# Altium schematic sheet GPS_GNSS.SchDoc
size A4; SheetNumber: 5; SheetTotal: 5
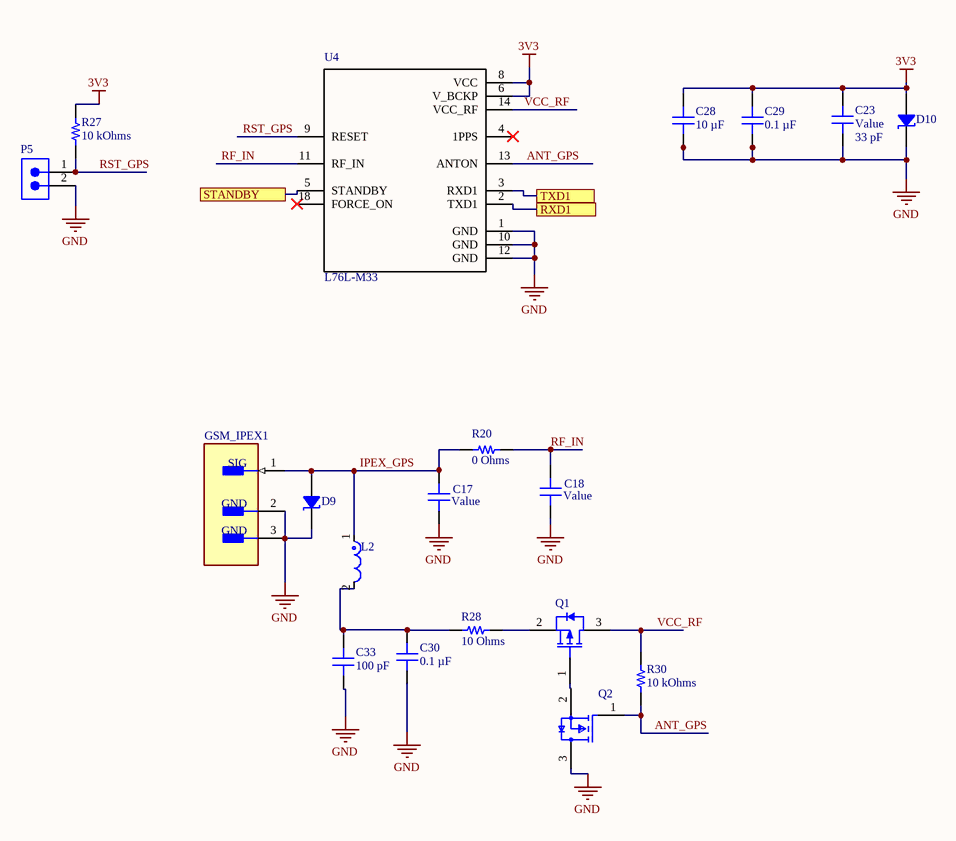
[diagram p0: GPS_GNSS.SchDoc]

## Parts
C17  Value  [CAP 0402_1005]
C18  Value  [CAP 0402_1005]
C23  Value  Capacitance: 33 pF  [CAP 0402_1005]
C28  10 µF  [CAP 0805_2012]
C29  0.1 µF  [CAP 0402_1005]
C30  0.1 µF  [CAP 0402_1005]
C33  100 pF  [CAP 0402_1005]
D9  PESD5V0S1USF,315  [NEXPERIA SOD962-2 DSN0603-2]  (value not drawn)
D10  ESD5Z3.3T5G  [SOD523F]  (value not drawn)
GSM_IPEX1  U.FL-R-SMT-1(10)  [FP-U_FL-R-SMT-1_10-MFG]  (value not drawn)
L2  LQG15HS47NJ02J  [FP-LQG15HH_02-IPC_B]  (value not drawn)
P5  MTLW-102-05-G-S-172  [SMTC-MTLW-102-05-X-S-172]  (value not drawn)
Q1  AO3401A  [AO-SOT-23-3L_V]  (value not drawn)
Q2  AO3400A  [FP-SOT23-MFG]  (value not drawn)
R20  0 Ohms  [RES 0402_1005]
R27  10 kOhms  [RES 0402_1005]
R28  10 Ohms  [RES 0402_1005]
R30  10 kOhms  [RES 0402_1005]
U4  L76L-M33  [*XCVR_L76L-M33]

## Ports
RXD1, STANDBY, TXD1

## Nets
3V3: C23.2 C28.2 C29.2 D10.1 R27.2 U4.6(V_BCKP) U4.8(VCC)
GND: C17.1 C18.1 C23.1 C28.1 C29.1 C30.1 C33.1 D9.1 D10.2 GSM_IPEX1.2(GND) GSM_IPEX1.3(GND) P5.2 Q2.3(D) U4.1(GND) U4.10(GND) U4.12(GND)
ANT_GPS: Q2.1(G) R30.1 U4.13(ANTON)
IPEX_GPS: C17.2 D9.2 GSM_IPEX1.1(SIG) L2.1 R20.1
RF_IN: C18.2 R20.2 U4.11(RF_IN)
RST_GPS: P5.1 R27.1 U4.9(RESET)
RXD1: U4.2(TXD1) ; port RXD1
STANDBY: U4.5(STANDBY) ; port STANDBY
TXD1: U4.3(RXD1) ; port TXD1
VCC_RF: Q1.3(DRAIN) R30.2 U4.14(VCC_RF)
NetC30_2: C30.2 C33.2 L2.2 R28.1
NetQ1_1: Q1.1(GATE) Q2.2(S)
NetQ1_2: Q1.2(SOURCE) R28.2

Not connected (* = marked no-connect by the designer): U4 4(1PPS)* 18(FORCE_ON)*

## Library data of the parts
C17 C18 = NMC0402X5R105K6.3TRPF: CAP SMT04021F6.3VDC; Capacitance: 1 µF; Part Number: NMC0402X5R105K6.3TRPF
C23 = GMC04CG330F50NT: CAP0402 COG 33PF 1% 50V; Part Number: GMC04CG330F50NT
C28 = GMC21X7S106K6R3NT: CAP0805 X7S 10UF 10% 6.3V; manufacturer: Cal-Chip Electronics, Inc.; Part Number: GMC21X7S106K6R3NT; Capacitance: 10 µF; Applications: General Purpose; componentlink1description: Datasheet; componentlink1url: https://calchip.com/wp-content/uploads/2024/02/gmc_series-1.pdf; componentlink2description: DigiKey Link; componentlink2url: https://www.digikey.com/en/products/detail/cal-chip-electronics-inc/GMC21X7S106K6R3NT/25820663; Device Package: 0805 (2012 Metric); lastupdated: 06/04/2026 7:28:46 PM; Lifecycle Status: Active; Minimum Order: 1; Mounting Type: Surface Mount, MLCC; Operating Temperature: -55°C ~ 125°C; Package / Case: 0805 (2012 Metric); packaging: TapeAndReel; partid: 69922; price: 0.08; series: GMC; Size / Dimension: 0.079" L x 0.049" W (2.00mm x 1.25mm); Supplier 1: DigiKey; Supplier Part Number 1: 4713-GMC21X7S106K6R3NTCT-ND; Temperature Coefficient: X7S; Thickness (Max): 0.057" (1.45mm); Tolerance: ±10%; value: 10 µF; Voltage - Rated: 6.3V
C29 C30 = 885012105001: CAP CER 0.1UF 6.3V X5R 0402; manufacturer: Würth Elektronik; Tolerance: ±20%; Part Number: 885012105001; Capacitance: 0.1 µF; Applications: General Purpose; componentlink1description: Datasheet; componentlink1url: https://katalog.we-online.de/pbs/datasheet/885012105001.pdf; componentlink2description: DigiKey Link; componentlink2url: https://www.digikey.com/en/products/detail/würth-elektronik/885012105001/5453333; Device Package: 0402 (1005 Metric); lastupdated: 06/04/2026 7:11:10 PM; Lifecycle Status: Active; Minimum Order: 1; Mounting Type: Surface Mount, MLCC; Operating Temperature: -55°C ~ 85°C; Package / Case: 0402 (1005 Metric); packaging: TapeAndReel; partid: 1931; Part Status: Active; price: 0.01; series: WCAP-CSGP; Size / Dimension: 0.039" L x 0.020" W (1.00mm x 0.50mm); Supplier 1: DigiKey; Supplier Part Number 1: 732-7478-1-ND; Temperature Coefficient: X5R; Thickness (Max): 0.022" (0.55mm); value: 0.1 µF; Voltage - Rated: 6.3V
C33 = GMC04CG101F16NT: CAP0402 COG 100PF 1% 16V; manufacturer: Cal-Chip Electronics, Inc.; Temperature Coefficient: C0G, NP0; Part Number: GMC04CG101F16NT; Capacitance: 100 pF; Applications: General Purpose; componentlink1description: Datasheet; componentlink1url: https://calchip.com/wp-content/uploads/2024/02/gmc_series-1.pdf; componentlink2description: DigiKey Link; componentlink2url: https://www.digikey.com/en/products/detail/cal-chip-electronics-inc/GMC04CG101F16NT/22577097; Device Package: 0402 (1005 Metric); lastupdated: 06/04/2026 7:07:17 PM; Lifecycle Status: Active; Minimum Order: 1; Mounting Type: Surface Mount, MLCC; Operating Temperature: -55°C ~ 125°C; Package / Case: 0402 (1005 Metric); packaging: TapeAndReel; partid: 63248; price: 0.01; series: GMC; Size / Dimension: 0.039" L x 0.020" W (1.00mm x 0.50mm); Supplier 1: DigiKey; Supplier Part Number 1: 4713-GMC04CG101F16NTCT-ND; Thickness (Max): 0.022" (0.55mm); Tolerance: ±1%; value: 100 pF; Voltage - Rated: 16V
D9 = PESD5V0S1USF,315: TVS DIODE 5VWM 11VC DSN0603-2; Part Number: PESD5V0S1USF,315
D10 = ESD5Z3.3T5G: TVS DIODE 3.3VWM 14.1VC SOD523; Part Number: ESD5Z3.3T5G
GSM_IPEX1 = CMP-2000-05152-3: CONN U.FL RCPT STR 50 OHM SMD; Max Frequency: 6GHz; Connector Type: Coaxial; Body Plating: Silver; Body Material: Bronze; Impedance: 50R; Dielectric Material: Polymer; Insulation Resistance: 500MR; Gender: Male; Packaging: Cut Tape; Length: 3mm; Package Quantity: 2500; Termination: Solder; Lead Free: Lead Free; Series: U.FL; Min Operating Temperature: -40°C; Fastening Type: Snap; Contact Material: Brass; Orientation: Straight; Wire/Cable Type: Coaxial; Frequency: 6GHz; Contact Plating: Gold; Depth: 3.1mm; Weight: 0.001764oz; Max Operating Temperature: 90°C; Radiation Hardening: No; REACH SVHC: No SVHC; Mount: Surface Mount; Housing Color: Beige
L2 = CMP-06042-003943-1: Multilayer type RF Inductor 47nH ±5% 0.72Ω 300mA 0402
P5 = CMP-1024-00064-1: Low Profile .025" SQ Post Header, Through-hole, Vertical, -55 to 125 degC, 2.54 mm Pitch, 2-Pin, Male, RoHS; Manufacturer: Samtec; Pitch: 2.54 mm; ComponentLink2URL: http://www.samtec.com/documents/webfiles/pdf/MTLW_TH.PDF; PackageDescription: Low Profile Terminal Assembly; ComponentLink3URL: http://www.samtec.com/documents/webfiles/cpdf/MTLW-1XX-XX-XX-X-XXX-XX-XX-MKT1.pdf; PackageReference: MTLW-102-05-X-S-172; Mounting Technology: Through-hole; ComponentLink2Description: Datasheet; PackageVersion: T, 6/1991; Orientation: Vertical; DatasheetVersion: F-214; RoHS: True; ComponentLink3Description: Package Specification; ComponentLink1URL: http://www.samtec.com; Temperature Range: -55 to 125 degC; PartNumber: MTLW-102-05-G-S-172; ComponentLink1Description: Manufacturer URL
Q1 = CMP-2000-05778-1: P-Channel MOSFET, 30 V, 4 A, -55 to 150 degC, 3-Pin SOT-23-3L, RoHS, Tape and Reel; Manufacturer: Alpha and Omega; Output Power (Max): NotRequiredW; Power Dissipation: 1.4W; Rad Hardened: No; Drain Efficiency: NotRequired%; Drain-Source On-Volt: 30V; Noise Figure: NotRequireddB; Frequency (Max): NotRequiredMHz; Number of  Elements: 1; Gate-Source Voltage (Max): ?12V; Drain Current (Max): 4A; Channel Mode: Enhancement; Drain-Source On-Res: 0.044ohm; Type: PowerMOSFET; Polarity: P; Package URL: http://www.aosmd.com/res/packaging_information/SOT-23-3L.pdf; Datasheet URL: http://www.aosmd.com/res/data_sheets/AO3401A.pdf; Package Type: SOT-23; Package Description: 3-Pin Small Outline Transistor, Body 2.95 x 1.6 mm, Pitch 0.95 mm; Mounting: SurfaceMount; Manufacturer URL: http://www.aosmd.com/; Continuous Drain Current: 4A; Package Reference: SOT-23-3L; Mounting Technology: SurfaceMount; Operating Temperature Classification: Military; Power Gain: NotRequireddB; Datasheet Version: Rev. 3, 03/2011; Operating Temp Range: -55Cto150C; Pin Count: 3
Q2 = CMP-83955-000006-1: MOSFET N-CH 30V 5.7A SOT23; Input Capacitance: 630pF; Number of Elements: 1; Rds On Max: 26.5mR; Max Power Dissipation: 1.4W; Gate to Source Voltage (Vgs): 12V; Min Operating Temperature: -55°C; Lead Free: Lead Free; Number of Pins: 3; Drain to Source Voltage (Vdss): 30V; Case/Package: SOT-23; Mount: Surface Mount; Continuous Drain Current (ID): 5.7A; Radiation Hardening: No; Packaging: Tape and Reel; Max Operating Temperature: 150°C; Power Dissipation: 1.4W
R20 = CR0402AJ/-000GAS: RESA-AS 0402 0R JUMPER 63MW; Part Number: CR0402AJ/-000GAS; Value: 0 Ohms
R27 R30 = TNPU040210K0BZEP00: TNPU0402 10K 0.1% T-16 EP1 E3; Manufacturer: Vishay Dale; Power (Watts): 0.063W, 1/16W; Temperature Coefficient: ±5ppm/°C; Part Number: TNPU040210K0BZEP00; Value: 10 kOhms; ComponentLink1Description: Datasheet; ComponentLink1URL: http://www.vishay.com/docs/28779/tnpue3.pdf; ComponentLink2Description: DigiKey Link; ComponentLink2URL: https://www.digikey.com/en/products/detail/vishay-dale/TNPU040210K0BZEP00/10668512; Composition: Thin Film; Device Package: 0402 (1005 Metric); Features: Anti-Sulfur, Automotive AEC-Q200, Moisture Resistant; Height - Seated (Max): 0.016" (0.40mm); LastUpdated: 09/02/2024 8:29:39 PM; Lifecycle Status: Active; Minimum Order: 1; Number of Terminations: 2; Operating Temperature: -55°C ~ 125°C; Package / Case: 0402 (1005 Metric); Packaging: TapeAndReel; PartId: 49938; Part Status: Active; Price: 0.67; Ratings: AEC-Q200; Resistance: 10 kOhms; Series: TNPU e3; Size / Dimension: 0.039" L x 0.020" W (1.00mm x 0.50mm); Supplier 1: DigiKey; Supplier Part Number 1: 541-TNPU040210K0BZEP00CT-ND; Supplier Device Package: 0402; Tolerance: ±0.1%
R28 = TNPU040210K0BZEP00: TNPU0402 10K 0.1% T-16 EP1 E3; Manufacturer: Vishay Dale; Power (Watts): 0.063W, 1/16W; Resistance: 10 kOhms; Temperature Coefficient: ±5ppm/°C; Part Number: TNPU040210K0BZEP00; Value: 10 Ohms; ComponentLink1Description: Datasheet; ComponentLink1URL: http://www.vishay.com/docs/28779/tnpue3.pdf; ComponentLink2Description: DigiKey Link; ComponentLink2URL: https://www.digikey.com/en/products/detail/vishay-dale/TNPU040210K0BZEP00/10668512; Composition: Thin Film; Device Package: 0402 (1005 Metric); Features: Anti-Sulfur, Automotive AEC-Q200, Moisture Resistant; Height - Seated (Max): 0.016" (0.40mm); LastUpdated: 09/02/2024 8:29:39 PM; Lifecycle Status: Active; Minimum Order: 1; Number of Terminations: 2; Operating Temperature: -55°C ~ 125°C; Package / Case: 0402 (1005 Metric); Packaging: TapeAndReel; PartId: 49938; Part Status: Active; Price: 0.67; Ratings: AEC-Q200; Series: TNPU e3; Size / Dimension: 0.039" L x 0.020" W (1.00mm x 0.50mm); Supplier 1: DigiKey; Supplier Part Number 1: 541-TNPU040210K0BZEP00CT-ND; Supplier Device Package: 0402; Tolerance: ±0.1%
U4 = L76L-M33: L76-L is a concurrent receiver module integrating GPS, GLONASS, Galileo and QZSS systems. With 33 tracking channels, 99 acquisition channels and 210 PRN channels, L76-L can acquire and track any mix of GPS, GLONASS and SBAS signals. Designed to be compatible with Quectel L76 module in the compact and unified form factor, L76-L provides a built-in LNA for better performance in weak signal areas.; MF: Quectel; Package: Custom Quectel; Price: None; Check_prices: https://www.snapeda.com/parts/L76L-M33/Quectel/view-part/?ref=eda; SnapEDA_Link: https://www.snapeda.com/parts/L76L-M33/Quectel/view-part/?ref=snap; MP: L76L-M33; Availability: In Stock; Purchase-URL: https://www.snapeda.com/api/url_track_click_mouser/?unipart_id=681456&manufacturer=Quectel&part_name=L76L-M33&search_term= l76l-m33; Value: *